# Altium schematic sheet Sheet1.SchDoc (part 1 of 2)
size 594 x 420 mm; SheetNumber: 1; SheetTotal: 1
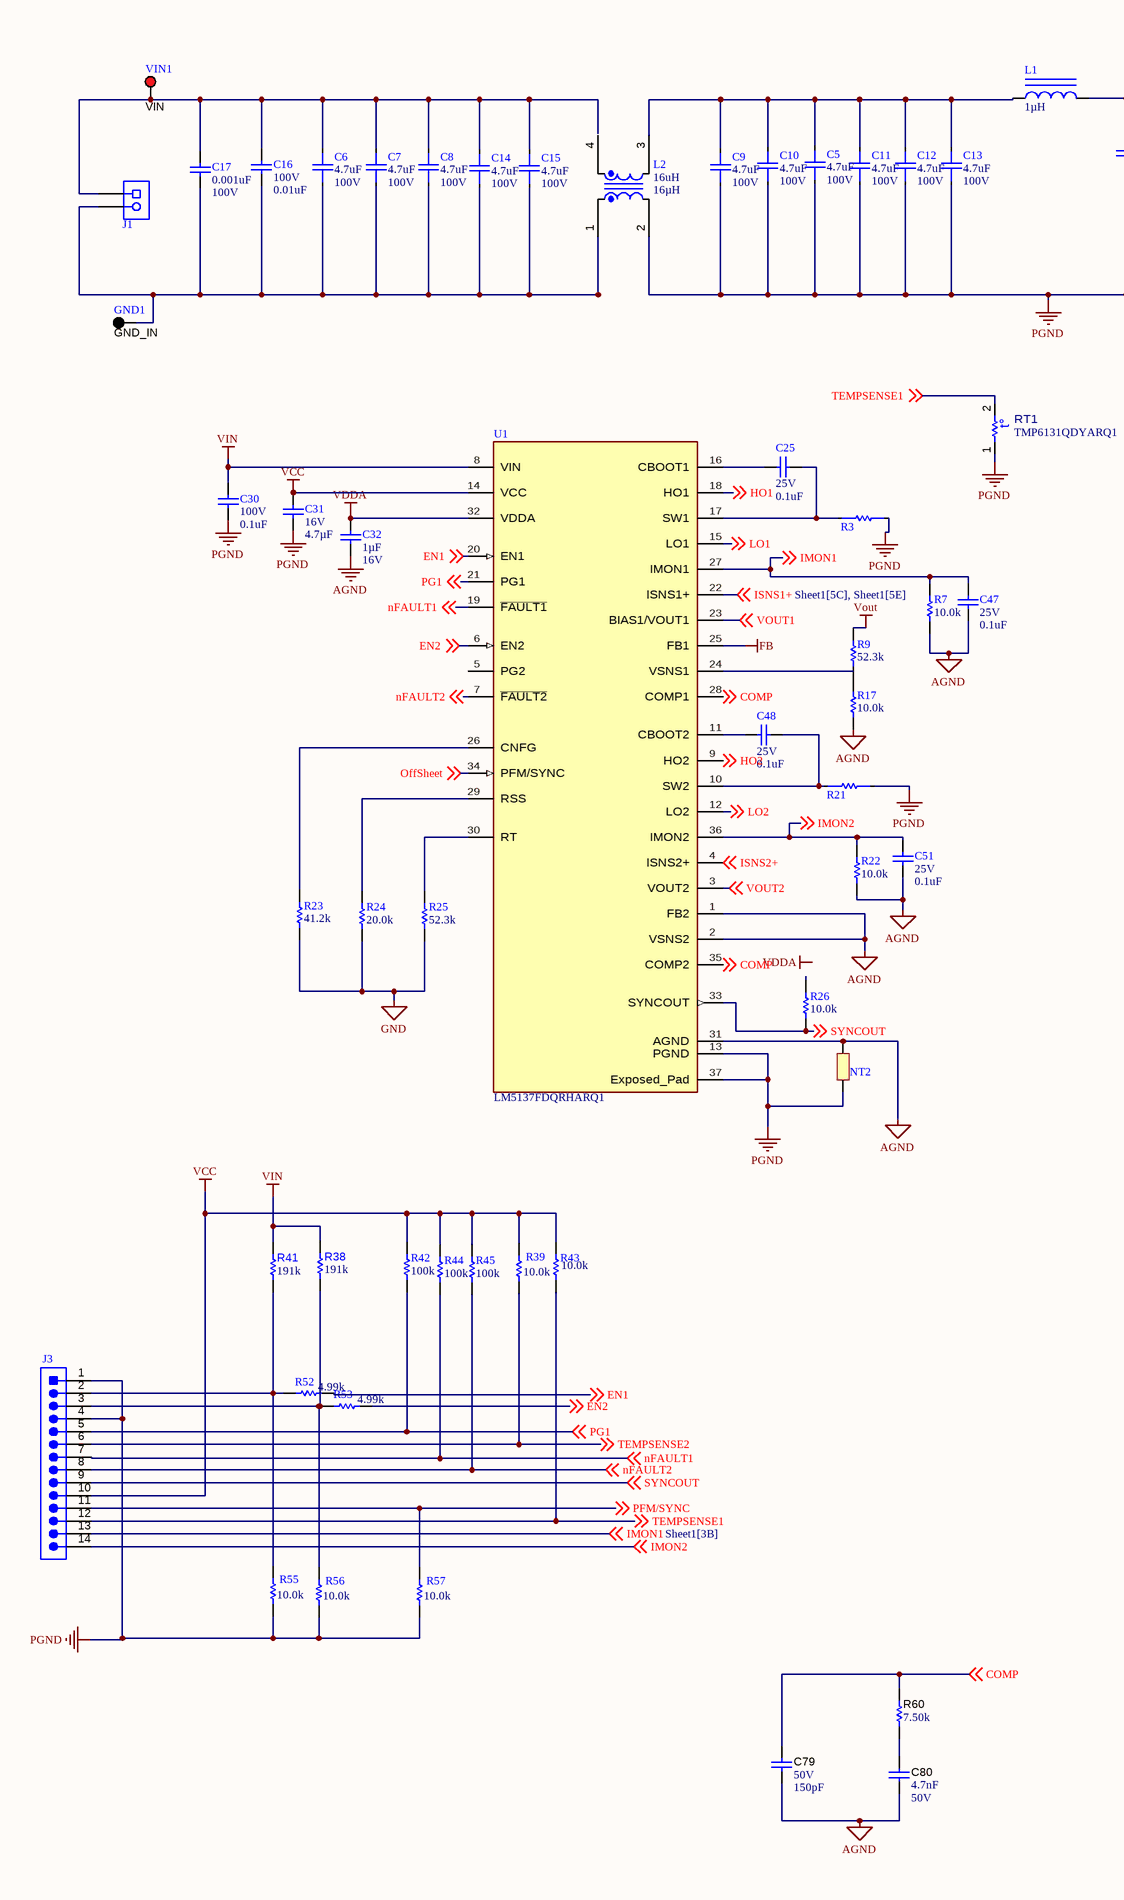
[diagram p0: Sheet1.SchDoc, left]
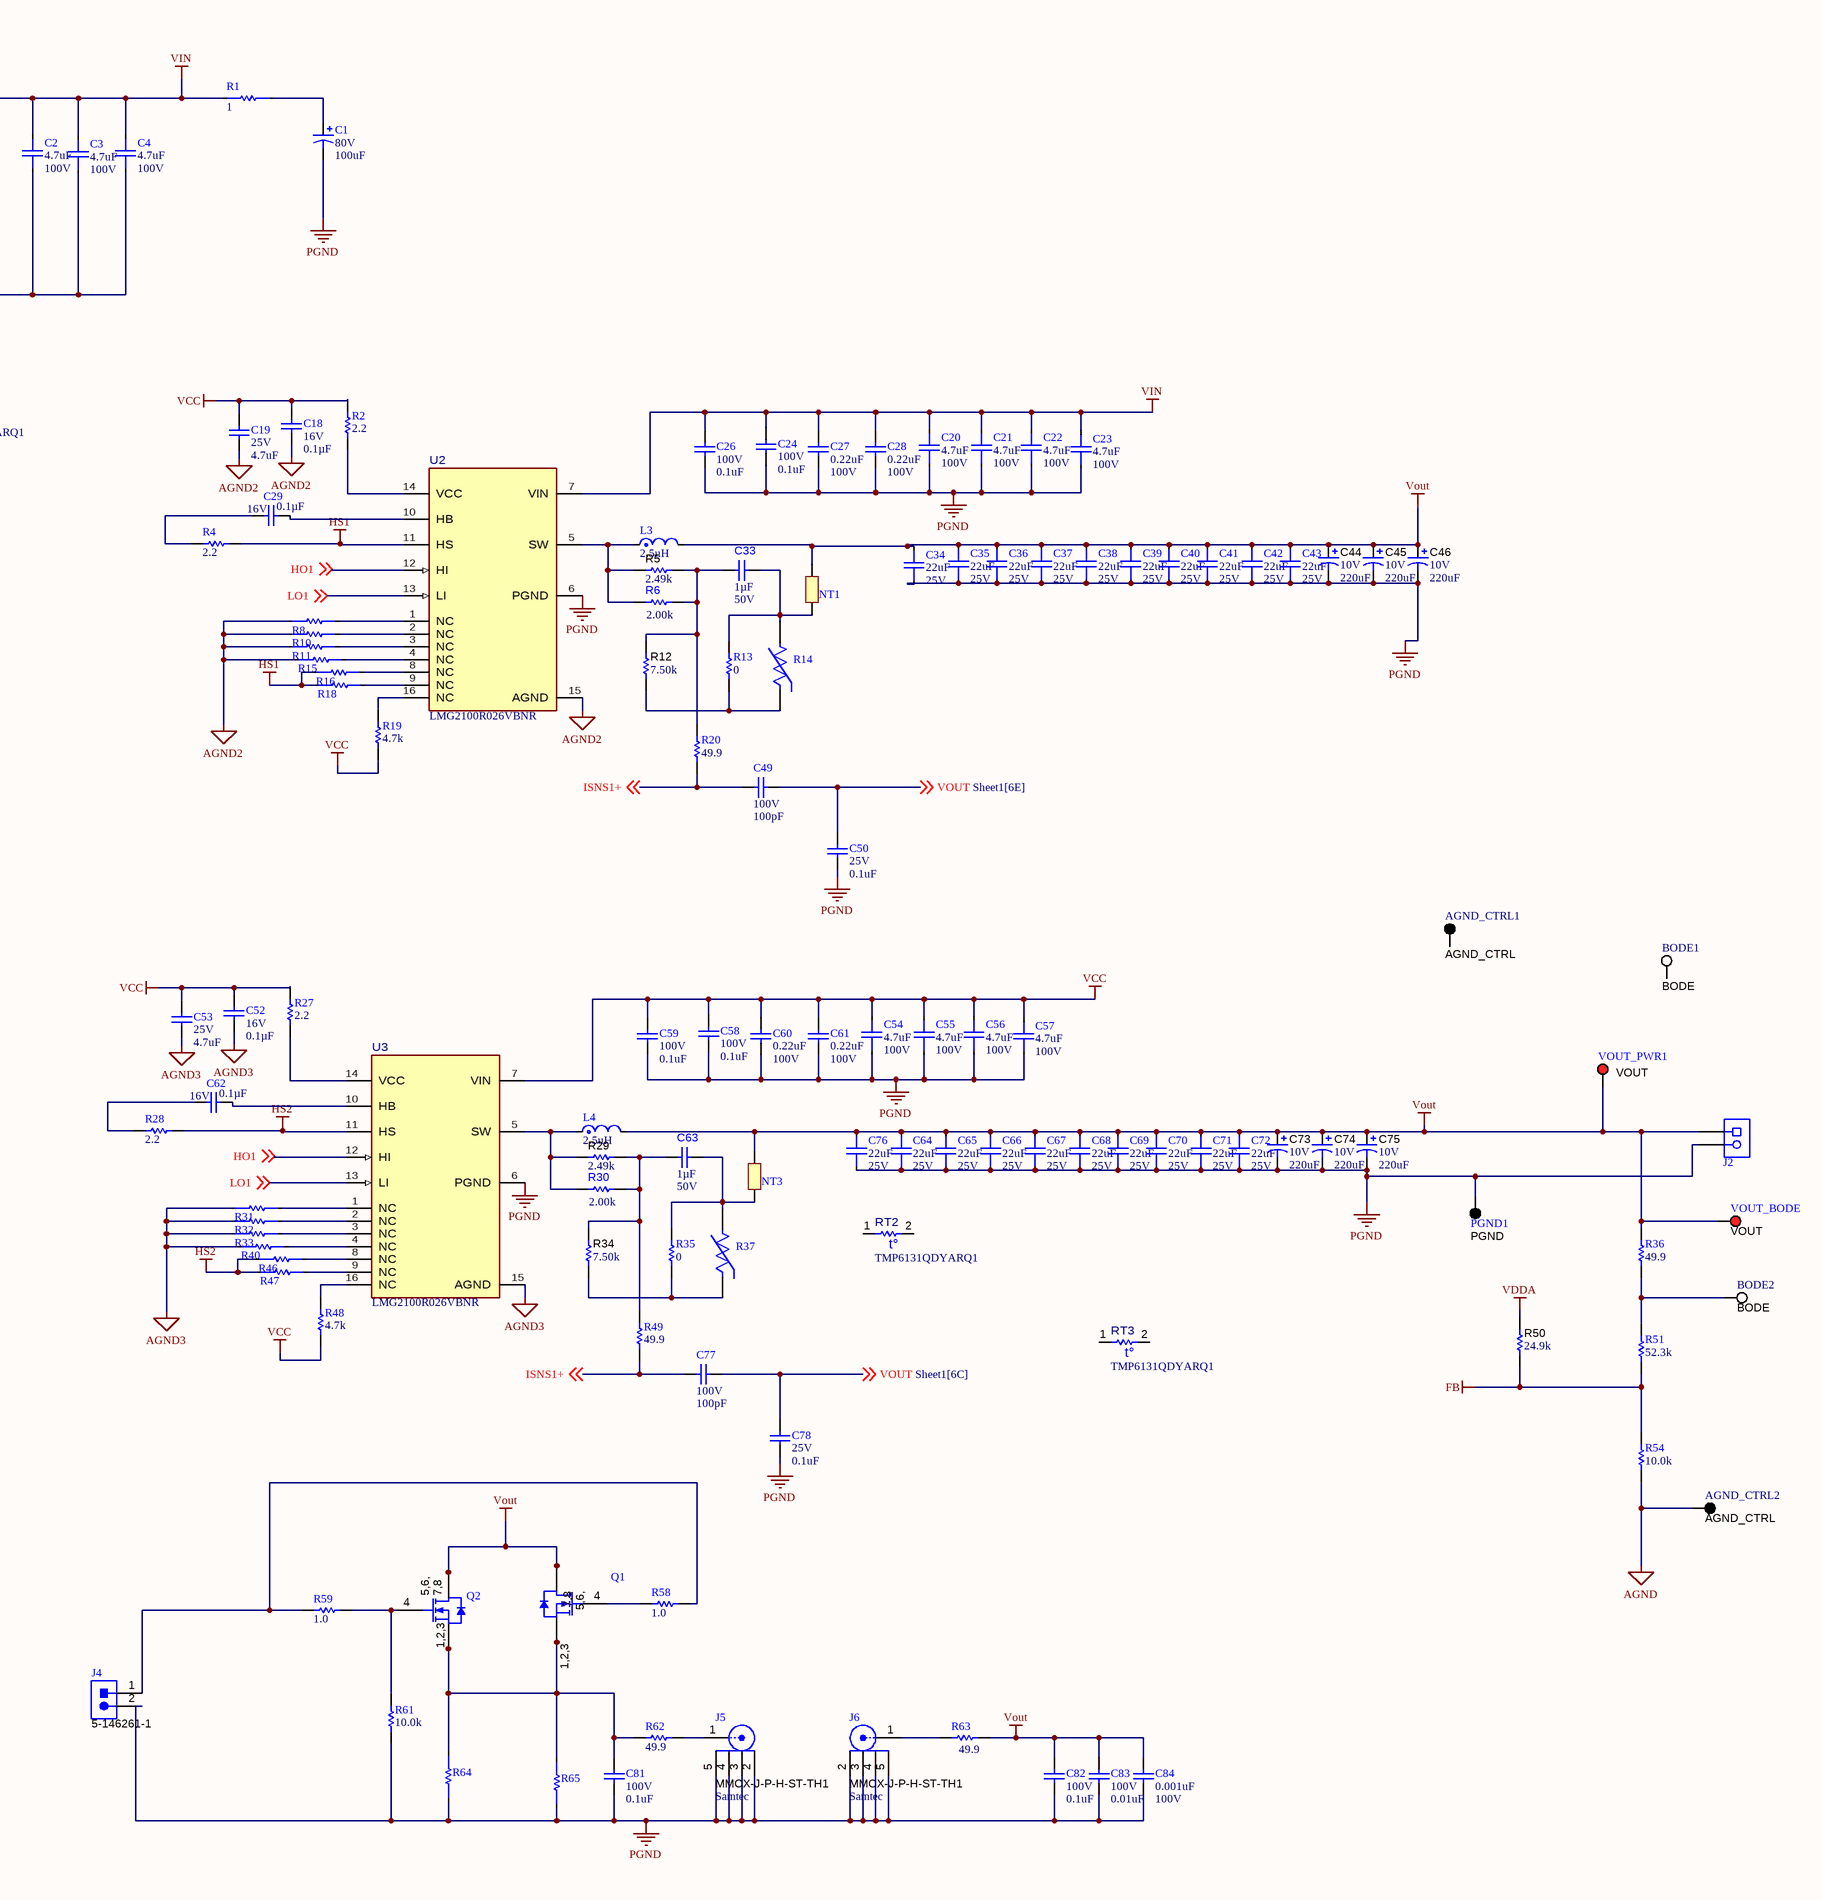
[diagram p1: Sheet1.SchDoc, right]

## Parts
AGND_CTRL1  AGND_CTRL  [Keystone5011]
AGND_CTRL2  AGND_CTRL  [Keystone5011]
BODE1  BODE  [Keystone5012]
BODE2  BODE  [Keystone5012]
C1  VDC_V: 80V  ValueDisplayed: 100uF  [SM_RADIAL_H13]  (hidden comment: EEV-FK1K101Q)
C2  ValueDisplayed: 4.7uF  VDC_V: 100V  [FP-GCJ32DC72A475KE01L_1210-MFG]  (hidden comment: GCJ32DC72A475KE01L)
C3  ValueDisplayed: 4.7uF  VDC_V: 100V  [FP-GCJ32DC72A475KE01L_1210-MFG]  (hidden comment: GCJ32DC72A475KE01L)
C4  ValueDisplayed: 4.7uF  VDC_V: 100V  [FP-GCJ32DC72A475KE01L_1210-MFG]  (hidden comment: GCJ32DC72A475KE01L)
C5  ValueDisplayed: 4.7uF  VDC_V: 100V  [FP-GCJ32DC72A475KE01L_1210-MFG]  (hidden comment: GCJ32DC72A475KE01L)
C6  ValueDisplayed: 4.7uF  VDC_V: 100V  [FP-GCJ32DC72A475KE01L_1210-MFG]  (hidden comment: GCJ32DC72A475KE01L)
C7  ValueDisplayed: 4.7uF  VDC_V: 100V  [FP-GCJ32DC72A475KE01L_1210-MFG]  (hidden comment: GCJ32DC72A475KE01L)
C8  ValueDisplayed: 4.7uF  VDC_V: 100V  [FP-GCJ32DC72A475KE01L_1210-MFG]  (hidden comment: GCJ32DC72A475KE01L)
C9  ValueDisplayed: 4.7uF  VDC_V: 100V  [FP-GCJ32DC72A475KE01L_1210-MFG]  (hidden comment: GCJ32DC72A475KE01L)
C10  ValueDisplayed: 4.7uF  VDC_V: 100V  [FP-GCJ32DC72A475KE01L_1210-MFG]  (hidden comment: GCJ32DC72A475KE01L)
C11  ValueDisplayed: 4.7uF  VDC_V: 100V  [FP-GCJ32DC72A475KE01L_1210-MFG]  (hidden comment: GCJ32DC72A475KE01L)
C12  ValueDisplayed: 4.7uF  VDC_V: 100V  [FP-GCJ32DC72A475KE01L_1210-MFG]  (hidden comment: GCJ32DC72A475KE01L)
C13  ValueDisplayed: 4.7uF  VDC_V: 100V  [FP-GCJ32DC72A475KE01L_1210-MFG]  (hidden comment: GCJ32DC72A475KE01L)
C14  ValueDisplayed: 4.7uF  VDC_V: 100V  [FP-GCJ32DC72A475KE01L_1210-MFG]  (hidden comment: GCJ32DC72A475KE01L)
C15  ValueDisplayed: 4.7uF  VDC_V: 100V  [FP-GCJ32DC72A475KE01L_1210-MFG]  (hidden comment: GCJ32DC72A475KE01L)
C16  Value2: 100V  ValueDisplayed: 0.01uF  [0603]  (hidden comment: GRM188R72A103KA01D)
C17  Cap_F: 0.001uF  VDC_V: 100V  [0603]  (hidden comment: CGA3E2X7R2A102K080AA)
C18  VDC_V: 16V  ValueDisplayed: 0.1µF  [0402]  (hidden comment: GCM155R71C104JA55D)
C19  VDC_V: 25V  ValueDisplayed: 4.7uF  [0805_HV]  (hidden comment: GCM21BC71E475KE36L)
C20  ValueDisplayed: 4.7uF  VDC_V: 100V  [FP-GCJ32DC72A475KE01L_1210-MFG]  (hidden comment: GCJ32DC72A475KE01L)
C21  ValueDisplayed: 4.7uF  VDC_V: 100V  [FP-GCJ32DC72A475KE01L_1210-MFG]  (hidden comment: GCJ32DC72A475KE01L)
C22  ValueDisplayed: 4.7uF  VDC_V: 100V  [FP-GCJ32DC72A475KE01L_1210-MFG]  (hidden comment: GCJ32DC72A475KE01L)
C23  ValueDisplayed: 4.7uF  VDC_V: 100V  [FP-GCJ32DC72A475KE01L_1210-MFG]  (hidden comment: GCJ32DC72A475KE01L)
C24  Value2: 100V  ValueDisplayed: 0.1uF  [0603]  (hidden comment: GRM188R72A104KA35D)
C25  Value2: 25V  ValueDisplayed: 0.1uF  [0603]  (hidden comment: CGA3E2X7R1E104K080AA)
C26  Value2: 100V  ValueDisplayed: 0.1uF  [0603]  (hidden comment: GRM188R72A104KA35D)
C27  Cap_F: 0.22uF  VDC_V: 100V  [0805]  (hidden comment: CL21B224KCFSNWE)
C28  Cap_F: 0.22uF  VDC_V: 100V  [0805]  (hidden comment: CL21B224KCFSNWE)
C29  VDC_V: 16V  ValueDisplayed: 0.1µF  [0402]  (hidden comment: GCM155R71C104JA55D)
C30  Value2: 100V  ValueDisplayed: 0.1uF  [0603]  (hidden comment: GRM188R72A104KA35D)
C31  Value2: 16V  Cap_F: 4.7µF  [0603]  (hidden comment: GRM188Z71C475KE21D)
C32  Cap_F: 1µF  VDC_V: 16V  [0603L]  (hidden comment: GCM188R71C105KA64J)
C33  Cap_F: 1µF  VDC_V: 50V  [0603]  (hidden comment: UMK107AB7105KA-T)
C34  ValueDisplayed: 22uF  VDC_V: 25V  [FP-CGA6P3X7R1E226M250AB_1210-MFG]  (hidden comment: CGA6P3X7R1E226M250AB)
C35  ValueDisplayed: 22uF  VDC_V: 25V  [FP-CGA6P3X7R1E226M250AB_1210-MFG]  (hidden comment: CGA6P3X7R1E226M250AB)
C36  ValueDisplayed: 22uF  VDC_V: 25V  [FP-CGA6P3X7R1E226M250AB_1210-MFG]  (hidden comment: CGA6P3X7R1E226M250AB)
C37  ValueDisplayed: 22uF  VDC_V: 25V  [FP-CGA6P3X7R1E226M250AB_1210-MFG]  (hidden comment: CGA6P3X7R1E226M250AB)
C38  ValueDisplayed: 22uF  VDC_V: 25V  [FP-CGA6P3X7R1E226M250AB_1210-MFG]  (hidden comment: CGA6P3X7R1E226M250AB)
C39  ValueDisplayed: 22uF  VDC_V: 25V  [FP-CGA6P3X7R1E226M250AB_1210-MFG]  (hidden comment: CGA6P3X7R1E226M250AB)
C40  ValueDisplayed: 22uF  VDC_V: 25V  [FP-CGA6P3X7R1E226M250AB_1210-MFG]  (hidden comment: CGA6P3X7R1E226M250AB)
C41  ValueDisplayed: 22uF  VDC_V: 25V  [FP-CGA6P3X7R1E226M250AB_1210-MFG]  (hidden comment: CGA6P3X7R1E226M250AB)
C42  ValueDisplayed: 22uF  VDC_V: 25V  [FP-CGA6P3X7R1E226M250AB_1210-MFG]  (hidden comment: CGA6P3X7R1E226M250AB)
C43  ValueDisplayed: 22uF  VDC_V: 25V  [FP-CGA6P3X7R1E226M250AB_1210-MFG]  (hidden comment: CGA6P3X7R1E226M250AB)
C44  VDC_V: 10V  ValueDisplayed: 220uF  [7343-31]  (hidden comment: T598D227M010ATE025)
C45  VDC_V: 10V  ValueDisplayed: 220uF  [7343-31]  (hidden comment: T598D227M010ATE025)
C46  VDC_V: 10V  ValueDisplayed: 220uF  [7343-31]  (hidden comment: T598D227M010ATE025)
C47  Value2: 25V  ValueDisplayed: 0.1uF  [0603]  (hidden comment: CGA3E2X7R1E104K080AA)
C48  Value2: 25V  ValueDisplayed: 0.1uF  [0603]  (hidden comment: CGA3E2X7R1E104K080AA)
C49  VDC_V: 100V  ValueDisplayed: 100pF  [0603]  (hidden comment: GCM1885C2A101JA16D)
C50  Value2: 25V  ValueDisplayed: 0.1uF  [0603]  (hidden comment: CGA3E2X7R1E104K080AA)
C51  Value2: 25V  ValueDisplayed: 0.1uF  [0603]  (hidden comment: CGA3E2X7R1E104K080AA)
C52  VDC_V: 16V  ValueDisplayed: 0.1µF  [0402]  (hidden comment: GCM155R71C104JA55D)
C53  VDC_V: 25V  ValueDisplayed: 4.7uF  [0805_HV]  (hidden comment: GCM21BC71E475KE36L)
C54  ValueDisplayed: 4.7uF  VDC_V: 100V  [FP-GCJ32DC72A475KE01L_1210-MFG]  (hidden comment: GCJ32DC72A475KE01L)
C55  ValueDisplayed: 4.7uF  VDC_V: 100V  [FP-GCJ32DC72A475KE01L_1210-MFG]  (hidden comment: GCJ32DC72A475KE01L)
C56  ValueDisplayed: 4.7uF  VDC_V: 100V  [FP-GCJ32DC72A475KE01L_1210-MFG]  (hidden comment: GCJ32DC72A475KE01L)
C57  ValueDisplayed: 4.7uF  VDC_V: 100V  [FP-GCJ32DC72A475KE01L_1210-MFG]  (hidden comment: GCJ32DC72A475KE01L)
C58  Value2: 100V  ValueDisplayed: 0.1uF  [0603]  (hidden comment: GRM188R72A104KA35D)
C59  Value2: 100V  ValueDisplayed: 0.1uF  [0603]  (hidden comment: GRM188R72A104KA35D)
C60  Cap_F: 0.22uF  VDC_V: 100V  [0805]  (hidden comment: CL21B224KCFSNWE)
C61  Cap_F: 0.22uF  VDC_V: 100V  [0805]  (hidden comment: CL21B224KCFSNWE)
C62  VDC_V: 16V  ValueDisplayed: 0.1µF  [0402]  (hidden comment: GCM155R71C104JA55D)
C63  Cap_F: 1µF  VDC_V: 50V  [0603]  (hidden comment: UMK107AB7105KA-T)
C64  ValueDisplayed: 22uF  VDC_V: 25V  [FP-CGA6P3X7R1E226M250AB_1210-MFG]  (hidden comment: CGA6P3X7R1E226M250AB)
C65  ValueDisplayed: 22uF  VDC_V: 25V  [FP-CGA6P3X7R1E226M250AB_1210-MFG]  (hidden comment: CGA6P3X7R1E226M250AB)
C66  ValueDisplayed: 22uF  VDC_V: 25V  [FP-CGA6P3X7R1E226M250AB_1210-MFG]  (hidden comment: CGA6P3X7R1E226M250AB)
C67  ValueDisplayed: 22uF  VDC_V: 25V  [FP-CGA6P3X7R1E226M250AB_1210-MFG]  (hidden comment: CGA6P3X7R1E226M250AB)
C68  ValueDisplayed: 22uF  VDC_V: 25V  [FP-CGA6P3X7R1E226M250AB_1210-MFG]  (hidden comment: CGA6P3X7R1E226M250AB)
C69  ValueDisplayed: 22uF  VDC_V: 25V  [FP-CGA6P3X7R1E226M250AB_1210-MFG]  (hidden comment: CGA6P3X7R1E226M250AB)
C70  ValueDisplayed: 22uF  VDC_V: 25V  [FP-CGA6P3X7R1E226M250AB_1210-MFG]  (hidden comment: CGA6P3X7R1E226M250AB)
C71  ValueDisplayed: 22uF  VDC_V: 25V  [FP-CGA6P3X7R1E226M250AB_1210-MFG]  (hidden comment: CGA6P3X7R1E226M250AB)
C72  ValueDisplayed: 22uF  VDC_V: 25V  [FP-CGA6P3X7R1E226M250AB_1210-MFG]  (hidden comment: CGA6P3X7R1E226M250AB)
C73  VDC_V: 10V  ValueDisplayed: 220uF  [7343-31]  (hidden comment: T598D227M010ATE025)
C74  VDC_V: 10V  ValueDisplayed: 220uF  [7343-31]  (hidden comment: T598D227M010ATE025)
C75  VDC_V: 10V  ValueDisplayed: 220uF  [7343-31]  (hidden comment: T598D227M010ATE025)
C76  ValueDisplayed: 22uF  VDC_V: 25V  [FP-CGA6P3X7R1E226M250AB_1210-MFG]  (hidden comment: CGA6P3X7R1E226M250AB)
C77  VDC_V: 100V  ValueDisplayed: 100pF  [0603]  (hidden comment: GCM1885C2A101JA16D)
C78  Value2: 25V  ValueDisplayed: 0.1uF  [0603]  (hidden comment: CGA3E2X7R1E104K080AA)
C79  VDC_V: 50V  ValueDisplayed: 150pF  [0603]  (hidden comment: 06035A151JAT2A)
C80  Cap_F: 4.7nF  VDC_V: 50V  [0603]  (hidden comment: C0603C472J5RACTU)
C81  Value2: 100V  ValueDisplayed: 0.1uF  [0603]  (hidden comment: GRM188R72A104KA35D)
C82  Value2: 100V  ValueDisplayed: 0.1uF  [0603]  (hidden comment: GRM188R72A104KA35D)
C83  Value2: 100V  ValueDisplayed: 0.01uF  [0603]  (hidden comment: GRM188R72A103KA01D)
C84  Cap_F: 0.001uF  VDC_V: 100V  [0603]  (hidden comment: CGA3E2X7R2A102K080AA)
GND1  GND_IN  [Keystone5011]
J1  EM292902-UL  [Eaton_EM292902]  (value not drawn)
J2  EM292902-UL  [Eaton_EM292902]  (value not drawn)
J3  TSW-114-07-G-S  [TSW-114-07-G-S]  (value not drawn)
J4  5-146261-1  [CONN_5-146261-1]
J5  MMCX-J-P-H-ST-TH1  Manufacturer: Samtec  [Samtec_MMCX-J-P-H-ST-TH1]
J6  MMCX-J-P-H-ST-TH1  Manufacturer: Samtec  [Samtec_MMCX-J-P-H-ST-TH1]
L1  ValueDisplayed: 1µH  [VCHA105D]  (hidden comment: VCHA105D-1R0MS6)
L2  value 16uH  ValueDisplayed: 16µH  [WE-CMB_NiZn_S]  (hidden comment: 7448421016)
L3  value 2.5uH  [FP-VCUD128T-2R5MS8_SMT_IND_13MM3_12MM8-MFG]  (hidden comment: VCUD128T-2R5MS8)
L4  value 2.5uH  [FP-VCUD128T-2R5MS8_SMT_IND_13MM3_12MM8-MFG]  (hidden comment: VCUD128T-2R5MS8)
NT1  Net-Tie  [Net-Tie_10mil]  (value not drawn)  (net tie, no BOM)
NT2  Net-Tie  [Net-Tie_10mil]  (value not drawn)  (net tie, no BOM)
NT3  Net-Tie  [Net-Tie_10mil]  (value not drawn)  (net tie, no BOM)
PGND1  PGND  [Keystone5011]
Q1  CSD17570Q5B  [DNK0008A]  (value not drawn)
Q2  CSD17570Q5B  [DNK0008A]  (value not drawn)
R1  value 1  [FP-RCL12251R00FKEG_2512-MFG]  (hidden comment: RCL12251R00FKEG)
R2  ValueDisplayed: 2.2  [0402]  (hidden comment: CRCW04022R20JNED)
R3  CRCW06030000Z0EAHP  [FP-CRCW06030000Z0EAHP_0603-MFG]  (value not drawn)
R4  ValueDisplayed: 2.2  [0402]  (hidden comment: CRCW04022R20JNED)
R5  ValueDisplayed: 2.49k  [1210]  (hidden comment: RC1210FR-072K49L)
R6  ValueDisplayed: 2.00k  [1210]  (hidden comment: RC1210FR-072KL)
R7  ValueDisplayed: 10.0k  [0603]  (hidden comment: CRCW060310K0FKEA)
R8  CRCW06030000Z0EAHP  [FP-CRCW06030000Z0EAHP_0603-MFG]  (value not drawn)
R9  ValueDisplayed: 52.3k  [0603L]  (hidden comment: CRCW060352K3FKEA)
R10  CRCW06030000Z0EAHP  [FP-CRCW06030000Z0EAHP_0603-MFG]  (value not drawn)
R11  CRCW06030000Z0EAHP  [FP-CRCW06030000Z0EAHP_0603-MFG]  (value not drawn)
R12  ValueDisplayed: 7.50k  [0603]  (hidden comment: CRCW06037K50FKEA)
R13  ValueDisplayed: 0  [0603]  (hidden comment: CRCW06030000Z0EA)
R14  NCU18WB473J6SRB  [FP-NCU18WB473J6SRB_0603-MFG]  (value not drawn)
R15  CRCW06030000Z0EAHP  [FP-CRCW06030000Z0EAHP_0603-MFG]  (value not drawn)
R16  CRCW06030000Z0EAHP  [FP-CRCW06030000Z0EAHP_0603-MFG]  (value not drawn)
R17  ValueDisplayed: 10.0k  [0603]  (hidden comment: CRCW060310K0FKEA)
R18  CRCW06030000Z0EAHP  [FP-CRCW06030000Z0EAHP_0603-MFG]  (value not drawn)
R19  ValueDisplayed: 4.7k  [0603]  (hidden comment: CRCW06034K70JNEA)
R20  ValueDisplayed: 49.9  [0603L]  (hidden comment: CRCW060349R9FKEA)
R21  CRCW06030000Z0EAHP  [FP-CRCW06030000Z0EAHP_0603-MFG]  (value not drawn)
R22  ValueDisplayed: 10.0k  [0603]  (hidden comment: CRCW060310K0FKEA)
R23  ValueDisplayed: 41.2k  [0603]  (hidden comment: CRCW060341K2FKEA)
R24  ValueDisplayed: 20.0k  [0603S]  (hidden comment: CRCW060320K0FKEA)
R25  ValueDisplayed: 52.3k  [0603L]  (hidden comment: CRCW060352K3FKEA)
R26  ValueDisplayed: 10.0k  [0603]  (hidden comment: CRCW060310K0FKEA)
R27  ValueDisplayed: 2.2  [0402]  (hidden comment: CRCW04022R20JNED)
R28  ValueDisplayed: 2.2  [0402]  (hidden comment: CRCW04022R20JNED)
R29  ValueDisplayed: 2.49k  [1210]  (hidden comment: RC1210FR-072K49L)
R30  ValueDisplayed: 2.00k  [1210]  (hidden comment: RC1210FR-072KL)
R31  CRCW06030000Z0EAHP  [FP-CRCW06030000Z0EAHP_0603-MFG]  (value not drawn)
R32  CRCW06030000Z0EAHP  [FP-CRCW06030000Z0EAHP_0603-MFG]  (value not drawn)
R33  CRCW06030000Z0EAHP  [FP-CRCW06030000Z0EAHP_0603-MFG]  (value not drawn)
R34  ValueDisplayed: 7.50k  [0603]  (hidden comment: CRCW06037K50FKEA)
R35  ValueDisplayed: 0  [0603]  (hidden comment: CRCW06030000Z0EA)
R36  ValueDisplayed: 49.9  [0603L]  (hidden comment: CRCW060349R9FKEA)
R37  NCU18WB473J6SRB  [FP-NCU18WB473J6SRB_0603-MFG]  (value not drawn)
R38  ValueDisplayed: 191k  [0603]  (hidden comment: CRCW0603191KFKEA)
R39  ValueDisplayed: 10.0k  [0603]  (hidden comment: CRCW060310K0FKEA)
R40  CRCW06030000Z0EAHP  [FP-CRCW06030000Z0EAHP_0603-MFG]  (value not drawn)
R41  ValueDisplayed: 191k  [0603]  (hidden comment: CRCW0603191KFKEA)
R42  ValueDisplayed: 100k  [0603L]  (hidden comment: CRCW0603100KFKEA)
R43  ValueDisplayed: 10.0k  [0603]  (hidden comment: CRCW060310K0FKEA)
R44  ValueDisplayed: 100k  [0603L]  (hidden comment: CRCW0603100KFKEA)
R45  ValueDisplayed: 100k  [0603L]  (hidden comment: CRCW0603100KFKEA)
R46  CRCW06030000Z0EAHP  [FP-CRCW06030000Z0EAHP_0603-MFG]  (value not drawn)
R47  CRCW06030000Z0EAHP  [FP-CRCW06030000Z0EAHP_0603-MFG]  (value not drawn)
R48  ValueDisplayed: 4.7k  [0603]  (hidden comment: CRCW06034K70JNEA)
R49  ValueDisplayed: 49.9  [0603L]  (hidden comment: CRCW060349R9FKEA)
R50  ValueDisplayed: 24.9k  [0603]  (hidden comment: RC0603FR-0724K9L)
R51  ValueDisplayed: 52.3k  [0603L]  (hidden comment: CRCW060352K3FKEA)
R52  ValueDisplayed: 4.99k  [0603]  (hidden comment: CRCW06034K99FKEA)
R53  ValueDisplayed: 4.99k  [0603]  (hidden comment: CRCW06034K99FKEA)
R54  ValueDisplayed: 10.0k  [0603]  (hidden comment: CRCW060310K0FKEA)
R55  ValueDisplayed: 10.0k  [0603]  (hidden comment: CRCW060310K0FKEA)
R56  ValueDisplayed: 10.0k  [0603]  (hidden comment: CRCW060310K0FKEA)
R57  ValueDisplayed: 10.0k  [0603]  (hidden comment: CRCW060310K0FKEA)
R58  ValueDisplayed: 1.0  [0603]  (hidden comment: CRCW06031R00JNEA)
R59  ValueDisplayed: 1.0  [0603]  (hidden comment: CRCW06031R00JNEA)
R60  ValueDisplayed: 7.50k  [0603]  (hidden comment: CRCW06037K50FKEA)
R61  ValueDisplayed: 10.0k  [0603]  (hidden comment: CRCW060310K0FKEA)
R62  ValueDisplayed: 49.9  [0603L]  (hidden comment: CRCW060349R9FKEA)
R63  ValueDisplayed: 49.9  [0603L]  (hidden comment: CRCW060349R9FKEA)
R64  CRCW06030000Z0EAHP  [FP-CRCW06030000Z0EAHP_0603-MFG]  (value not drawn)
R65  CRCW06030000Z0EAHP  [FP-CRCW06030000Z0EAHP_0603-MFG]  (value not drawn)
RT1  TMP6131QDYARQ1  [DYA0002A-MFG]
RT2  TMP6131QDYARQ1  [DYA0002A-MFG]
RT3  TMP6131QDYARQ1  [DYA0002A-MFG]
U1  LM5137FDQRHARQ1  [RHA0036D-MFG]
U2  LMG2100R026VBNR  [VBN0016A-MFG]
U3  LMG2100R026VBNR  [VBN0016A-MFG]
VIN1  VIN  [Keystone5010]
VOUT_BODE  VOUT  [Keystone5010]
VOUT_PWR1  VOUT  [Keystone5010]

## Nets
AGND: AGND_CTRL2.1 C32.2 C47.2 C51.2 C79.2 C80.2 NT2.2 R7.1 R17.1 R22.1 R54.1 U1.1(FB2) U1.2(VSNS2) U1.31(AGND)
AGND2: C18.2 C19.2 R8.1 R10.1 R11.1 R15.1 U2.15(AGND)
AGND3: C52.2 C53.2 R31.1 R32.1 R33.1 R40.1 U3.15(AGND)
FB: R50.1 R51.1 R54.2 U1.25(FB1)
GND: R23.1 R24.1 R25.1
HS1: R4.1 R16.1 R18.1 U2.11(HS)
HS2: R28.1 R46.1 R47.1 U3.11(HS)
PGND: C1.2(-) C2.1 C3.1 C4.1 C5.1 C9.1 C10.1 C11.1 C12.1 C13.1 C20.1 C21.1 C22.1 C23.1 C24.2 C26.2 C27.2 C28.2 C30.2 C31.2 C34.1 C35.1 C36.1 C37.1 C38.1 C39.1 C40.1 C41.1 C42.1 C43.1 C44.2(-) C45.2(-) C46.2(-) C50.2 C54.1 C55.1 C56.1 C57.1 C58.2 C59.2 C60.2 C61.2 C64.1 C65.1 C66.1 C67.1 C68.1 C69.1 C70.1 C71.1 C72.1 C73.2(-) C74.2(-) C75.2(-) C76.1 C78.2 C81.2 C82.2 C83.2 C84.2 J2.2 J3.1 J3.4 J4.2 J5.2 J5.3 J5.4 J5.5 J6.2 J6.3 J6.4 J6.5 L2.2 NT2.1 PGND1.1 R3.2 R21.2 R55.1 R56.1 R57.1 R61.1 R64.1 R65.1 RT1.1 U1.13(PGND) U1.37(Exposed_Pad) U2.6(PGND) U3.6(PGND)
VCC: C18.1 C19.1 C31.1 C52.1 C53.1 C54.2 C55.2 C56.2 C57.2 C58.1 C59.1 C60.1 C61.1 J3.10 R2.2 R19.1 R27.2 R39.2 R42.2 R43.2 R44.2 R45.2 R48.1 U1.14(VCC) U3.7(VIN)
VDDA: C32.1 R50.2 U1.32(VDDA)
VIN: C2.2 C3.2 C4.2 C20.2 C21.2 C22.2 C23.2 C24.1 C26.1 C27.1 C28.1 C30.1 L1.2 R1.2 R38.2 R41.2 U1.8(VIN) U2.7(VIN)
Vout: C34.2 C35.2 C36.2 C37.2 C38.2 C39.2 C40.2 C41.2 C42.2 C43.2 C44.1(+) C45.1(+) C46.1(+) C49.1 C50.1 C64.2 C65.2 C66.2 C67.2 C68.2 C69.2 C70.2 C71.2 C72.2 C73.1(+) C74.1(+) C75.1(+) C76.2 C77.1 C78.1 C82.1 C83.1 C84.1 J2.1 L3.2 L4.2 NT1.2 NT3.2 Q1.5(D) Q1.6(D) Q1.7(D) Q1.8(D) Q1.9(D) Q2.5(D) Q2.6(D) Q2.7(D) Q2.8(D) Q2.9(D) R9.2 R36.2 R63.1 VOUT_BODE.1 VOUT_PWR1.1 ; off-sheet VOUT
COMP: C79.1 R60.2 U1.28(COMP1) U1.35(COMP2) ; off-sheet COMP
EN1: R52.2 U1.20(EN1) ; off-sheet EN1
EN2: R53.2 U1.6(EN2) ; off-sheet EN2
HO1: U1.18(HO1) U2.12(HI) U3.12(HI) ; off-sheet HO1
HO2: U1.9(HO2) ; off-sheet HO2
IMON1: C47.1 J3.13 R7.2 U1.27(IMON1) ; off-sheet IMON1
IMON2: C51.1 J3.14 R22.2 U1.36(IMON2) ; off-sheet IMON2
ISNS1+: C49.2 C77.2 R20.1 R49.1 U1.22(ISNS1+) ; off-sheet ISNS1+
ISNS2+: U1.4(ISNS2+) ; off-sheet ISNS2+
LO1: U1.15(LO1) U2.13(LI) U3.13(LI) ; off-sheet LO1
LO2: U1.12(LO2) ; off-sheet LO2
nFAULT1: J3.7 R44.1 U1.19(~{FAULT1}) ; off-sheet nFAULT1
nFAULT2: J3.8 R45.1 U1.7(~{FAULT2}) ; off-sheet nFAULT2
OffSheet: U1.34(PFM/SYNC) ; off-sheet OffSheet
PFM/SYNC: J3.11 R57.2 ; off-sheet PFM/SYNC
PG1: J3.5 R42.1 U1.21(PG1) ; off-sheet PG1
SYNCOUT: J3.9 R26.1 U1.33(SYNCOUT) ; off-sheet SYNCOUT
TEMPSENSE1: J3.12 R43.1 RT1.2 ; off-sheet TEMPSENSE1
TEMPSENSE2: J3.6 R39.1 ; off-sheet TEMPSENSE2
VOUT1: U1.23(BIAS1/VOUT1) ; off-sheet VOUT1
VOUT2: U1.3(VOUT2) ; off-sheet VOUT2
NetBODE2_1: BODE2.1 R36.1 R51.2
NetC1_1: C1.1(+) R1.1
NetC5_2: C5.2 C9.2 C10.2 C11.2 C12.2 C13.2 L1.1 L2.3
NetC6_1: C6.1 C7.1 C8.1 C14.1 C15.1 C16.2 C17.2 GND1.1 J1.2 L2.1
NetC6_2: C6.2 C7.2 C8.2 C14.2 C15.2 C16.1 C17.1 J1.1 VIN1.1
NetC25_1: C25.1 R3.1 U1.17(SW1)
NetC25_2: C25.2 U1.16(CBOOT1)
NetC29_1: C29.1 R4.2
NetC29_2: C29.2 U2.10(HB)
NetC33_1: C33.1 NT1.1 R13.2 R14.2
NetC33_2: C33.2 R5.2 R6.2 R12.2 R20.2
NetC48_1: C48.1 U1.11(CBOOT2)
NetC48_2: C48.2 R21.1 U1.10(SW2)
NetC62_1: C62.1 R28.2
NetC62_2: C62.2 U3.10(HB)
NetC63_1: C63.1 NT3.1 R35.2 R37.2
NetC63_2: C63.2 R29.2 R30.2 R34.2 R49.2
NetC80_1: C80.1 R60.1
NetC81_1: C81.1 Q1.1(S) Q1.2(S) Q1.3(S) Q2.1(S) Q2.2(S) Q2.3(S) R62.2 R64.2 R65.2
NetJ3_2: J3.2 R41.1 R52.1 R55.2
NetJ3_3: J3.3 R38.1 R53.1 R56.2
NetJ4_1: J4.1 R58.2 R59.1
NetJ5_1: J5.1 R62.1
NetJ6_1: J6.1 R63.2
NetL3_1: L3.1 R5.1 R6.1 U2.5(SW)
NetL4_1: L4.1 R29.1 R30.1 U3.5(SW)
NetQ1_4: Q1.4(G) R58.1
NetQ2_4: Q2.4(G) R59.2 R61.2
NetR2_1: R2.1 U2.14(VCC)
NetR8_2: R8.2 U2.1(NC)
NetR9_1: R9.1 R17.2
NetR10_2: R10.2 U2.2(NC)
NetR11_2: R11.2 U2.3(NC)
NetR12_1: R12.1 R13.1 R14.1
NetR15_2: R15.2 U2.4(NC)
NetR16_2: R16.2 U2.8(NC)
NetR18_2: R18.2 U2.9(NC)
NetR19_2: R19.2 U2.16(NC)
NetR23_2: R23.2 U1.26(CNFG)
NetR24_2: R24.2 U1.29(RSS)
NetR25_2: R25.2 U1.30(RT)
NetR27_1: R27.1 U3.14(VCC)
NetR31_2: R31.2 U3.1(NC)
NetR32_2: R32.2 U3.2(NC)
NetR33_2: R33.2 U3.3(NC)
NetR34_1: R34.1 R35.1 R37.1
NetR40_2: R40.2 U3.4(NC)
NetR46_2: R46.2 U3.8(NC)
NetR47_2: R47.2 U3.9(NC)
NetR48_2: R48.2 U3.16(NC)

Not connected (* = marked no-connect by the designer): AGND_CTRL1 1; BODE1 1; L2 4; R26 2; RT2 1 2; RT3 1 2; U1 5(PG2) 24(VSNS1)

## Notes on the sheet
- Labels drawn without touching a wire or pin: VDDA
- DWG NO:
- REV:
- THIS DOCUMENT AND THE DATA DISCLOSED HEREIN OR
- HEREWITH IS THE PROPERTY OF ALTIUM LIMITED AND MAY
- BE FREELY DISTRIBUTED IN WHOLE. NO RIGHTS ARE
- RESERVED OR EXPRESS OR IMPLIED WARANTEE GIVEN.
- REVISION
- DESCRIPTION
- DATE
- APPROVED
- ENG:
- APPROVALS
- PROJECT
- DSN:
- CHK:
- REFERENCE DOCUMENTS
- PROJECT REVISION:
- TITLE
- DOCUMENT REVISION:
- DESIGN ITEM:
- BOM:
- FAB DWG:
- PCB DWG:
- ASSY DWG:
- SCALE:
- A2
- SIZE
- CAGE CODE
- FILE NAME
- DWG NO.
- SHEET
- OF
- REV
- (in symbol CMP-0123120-1) t°
- (in symbol CSD17570Q5B) 5,6,; 7,8; 1,2,3
- (in symbol TMP6131QDYARQ1) t°